# Altium schematic sheet M1.Melani.SchDoc
size A4; SheetNumber: 2; SheetTotal: 2
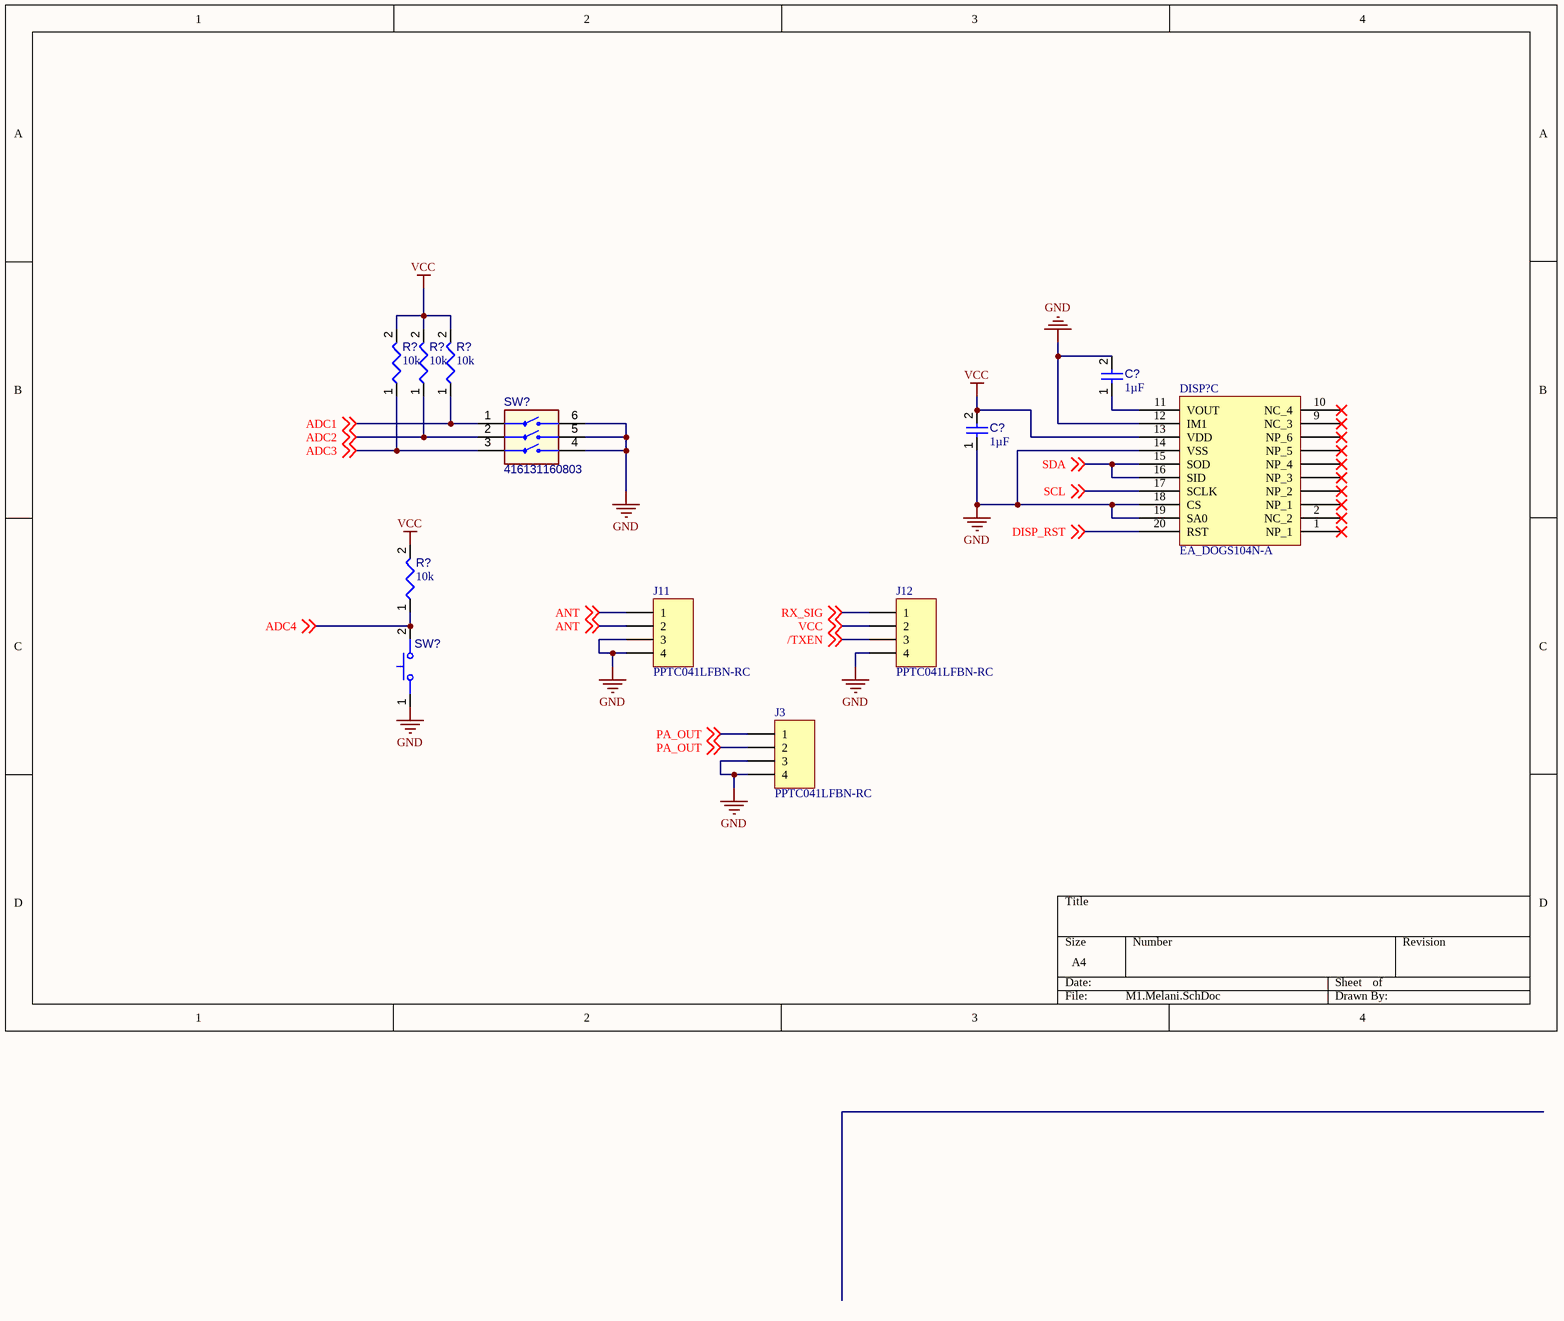
[diagram p0: M1.Melani.SchDoc]

## Parts
(Parts that share a designator on the sheet are numbered #1, #2 ... from top to bottom, then left to right.)
C?#1  value 1µF  [CAPC1608X94X35NL15T15]  (hidden comment: Capacitor 1 uF +/- 10% 16 V 0603)
C?#2  value 1µF  [CAPC1608X94X35NL15T15]  (hidden comment: Capacitor 1 uF +/- 10% 16 V 0603)
DISP?  EA_DOGS104N-A  (part C of 3)
J3  PPTC041LFBN-RC  [HDR1X4]
J11  PPTC041LFBN-RC  [HDR1X4]
J12  PPTC041LFBN-RC  [HDR1X4]
R?#1  value 10k  [RESC0402(1005)_L]  (hidden comment: 10KR2F)
R?#2  value 10k  [RESC0402(1005)_L]  (hidden comment: 10KR2F)
R?#3  value 10k  [RESC0402(1005)_L]  (hidden comment: 10KR2F)
R?#4  value 10k  [RESC0402(1005)_L]  (hidden comment: 10KR2F)
SW?#1  416131160803  [416131160803]
SW?#2  B3U-1000P-B  [OMRON-B3U-1000P-2-B_V]  (value not drawn)

## Nets
GND: C?#1.2 C?#2.1 DISP?.12(IM1) DISP?.14(VSS) DISP?.18(CS) DISP?.19(SA0) J3.3 J3.4 J11.3 J11.4 J12.4 SW?#1.4 SW?#1.5 SW?#1.6 SW?#2.1
VCC: C?#2.2 DISP?.13(VDD) J12.2 R?#1.2 R?#2.2 R?#3.2 R?#4.2 ; off-sheet VCC
/TXEN: J12.3 ; off-sheet /TXEN
ADC1: R?#3.1 SW?#1.1 ; off-sheet ADC1
ADC2: R?#2.1 SW?#1.2 ; off-sheet ADC2
ADC3: R?#1.1 SW?#1.3 ; off-sheet ADC3
ADC4: R?#4.1 SW?#2.2 ; off-sheet ADC4
ANT: J11.1 J11.2 ; off-sheet ANT
DISP_RST: DISP?.20(RST) ; off-sheet DISP_RST
PA_OUT: J3.1 J3.2 ; off-sheet PA_OUT
RX_SIG: J12.1 ; off-sheet RX_SIG
SCL: DISP?.17(SCLK) ; off-sheet SCL
SDA: DISP?.15(SOD) DISP?.16(SID) ; off-sheet SDA
NetC?#1_1: C?#1.1 DISP?.11(VOUT)

Not connected (* = marked no-connect by the designer): DISP? 1(NP_1)* 2(NC_2)* 9(NC_3)* 10(NC_4)* ?1(NP_6)* ?2(NP_5)* ?3(NP_4)* ?4(NP_3)* ?5(NP_2)* ?6(NP_1)*

## Library data of the parts
C?#1 C?#2 = CMP-001-00003-6: Chip Capacitor, 1 uF, +/- 10%, 16 V, 0603 (1608 Metric); Voltage Rating: 16V; Capacitor Type: Ceramic; Max Operating Temperature: 125°C; Pins: 2; Tolerance: 10%; Min Operating Temperature: -55°C; RoHS Compliant: True; Mounting Technology: SM; Case/Package: 0603
J3 J11 J12 = Header 4: Header, 4-Pin; LatestRevisionDate: 17-Jul-2002; LatestRevisionNote: Re-released for DXP Platform.; Publisher: Altium Limited
R?#1-R?#4 = CMP-009-00066-2: 10K 0.063W 1% 0402 (1005 Metric)  SMD; Power: 63mW; Case/Package: 0402; Mounting Technology: SMT; Pins: 2; Tolerance: 1%
SW?#1 = CMP-011-00012-3: WS-DISV 1.27 mm small compact SMD Dip Switch with top tape; ComponentLink1Description: Manufacturer URL; ComponentLink2Description: Datasheet; ComponentLink2URL: http://katalog.we-online.de/em/datasheet/4161311608xx.pdf; Pins: 6; ComponentLink1URL: http://www.we-online.com
SW?#2 = CMP-011-00011-3: Ultra-small Surface-mounting Tactile Switches with High Contact Reliability, SPST-NO, -25 to 70 degC, 2-Pin SMD, RoHS, Tape and Reel; Voltage Rating: 12V; Current Rating: 50mA; Pins: 2; RoHS Compliant: Details